# Altium schematic sheet 2_Test Points.schdoc
size 307 x 218 mm; Symbol: Drawing-Symbol_A4; Device: Drawing-Symbol_A4; @Project Name: KeyConnect; @Page Count: 2; @Update Date: 2026-02-08; @Create Date: 2026-02-05; @Schematic Name: Schematic1; @Page No: 2; @Page Name: Test Points; Company: EasyEDA.com; Version: V1.0; Page Size: A4; @Create Time: 19:36:37; @Update Time: 21:01:07; Width: 1170; Height: 825; Region Start: 1; X Region Count: 6; Y Region Count: 4; Blade Width: 10; Title Block Position: 3; @Board Name: Board1
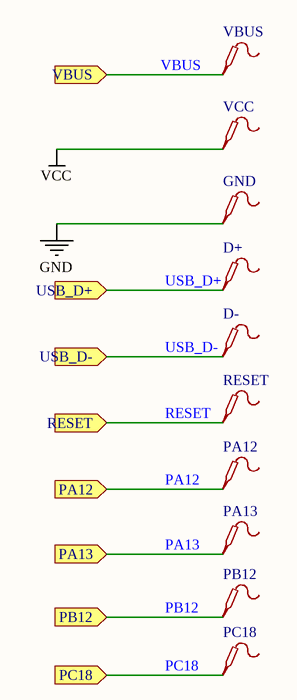
[diagram p0: 2_Test Points.schdoc]

## Parts
D+  (no value)  [Test-Point-0.5mm]
D-  (no value)  [Test-Point-0.5mm]
GND  (no value)  [Test-Point-0.5mm]
PA12  (no value)  [Test-Point-0.5mm]
PA13  (no value)  [Test-Point-0.5mm]
PB12  (no value)  [Test-Point-0.5mm]
PC18  (no value)  [Test-Point-0.5mm]
RESET  (no value)  [Test-Point-0.5mm]
VBUS  (no value)  [Test-Point-0.5mm]
VCC  (no value)  [Test-Point-0.5mm]

## Ports
PA12 (in), PA13 (in), PB12 (in), PC18 (in), RESET (in), USB_D+ (in), USB_D- (in), VBUS (in)

## Nets
GND: GND.1
VCC: VCC.1
PA12: PA12.1 ; port PA12
PA13: PA13.1 ; port PA13
PB12: PB12.1 ; port PB12
PC18: PC18.1 ; port PC18
RESET: RESET.1 ; port RESET
USB_D+: D+.1 ; port USB_D+
USB_D-: D-.1 ; port USB_D-
VBUS: VBUS.1 ; port VBUS

## Notes on the sheet
- 1
- 2
- 3
- 4
- 5
- 6
- A
- B
- C
- Schematic
- Schematic1
- Create at
- Update at
- 2026-02-05
- 2026-02-08
- Board
- Drawn
- Board1
- Page
- Test Points
- D
- Reviewed
- Version
- Size
- KeyConnect
- Page  2  Total  2
- V1.0
- A4
- EasyEDA.com

## Library data of the parts
D+ D- GND PA12 PA13 PB12 PC18 RESET VBUS VCC = Test-Point: Add into BOM: yes; Symbol: Test-Point; Device: Test-Point; Convert to PCB: yes